# Altium project Raun_Programmer_Board.PrjPcb
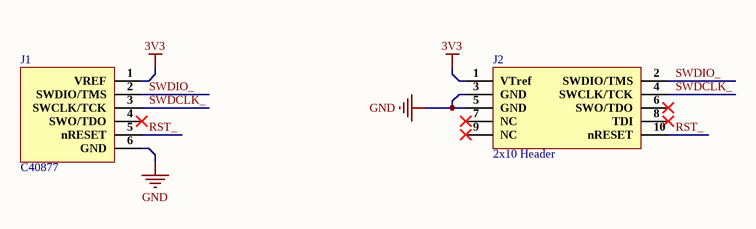
[diagram p0: Main_Sheet.SchDoc]
1 sheet, 2 parts. Net scope: global (net labels, ports and power ports of the same name join across sheets).
Board file: PB.PcbDoc

## Sheet Main_Sheet.SchDoc
size A4; SheetNumber: 1; SheetTotal: 1

### Parts
J1  C40877  [HDR_F_1X6]
J2  2x10 Header  [10Pin 1.27mm]

### Nets
3V3: J1.1(VREF) J2.1(VTref)
GND: J1.6(GND) J2.3(GND) J2.5(GND)
RST_: J1.5(nRESET) J2.10(nRESET)
SWDCLK_: J1.3(SWCLK/TCK) J2.4(SWCLK/TCK)
SWDIO_: J1.2(SWDIO/TMS) J2.2(SWDIO/TMS)

Not connected (* = marked no-connect by the designer): J1 4(SWO/TDO)*; J2 6(SWO/TDO)* 7(NC)* 8(TDI)* 9(NC)*

### Library data of the parts
J1 = C40877: 2.54mm Straight 1x6P 6 1 Straight,P=2.54mm Female Headers ROHS; Manufacturer: BOOMELE; Manufacturer Part Number: C40877; LCSC Part Number: C40877; ComponentLink1Description: LCSC; ComponentLink1URL: https://lcsc.com/product-detail/span-style-background-color-ff0-Female-span-Headers_BOOMELE-Boom-Precision-Elec-C40877_C40877.html
J2 = DW127R-22-10-23: 1A Straight Square Pins 1mm 3mm 2 10 2.3mm 1.27mm 1.27mm 2x5P Straight,P=1.27mm Pin Headers ROHS; Manufacturer: DEALON; Manufacturer Part Number: DW127R-22-10-23; Package: Custom; LCSC Part Number: C2935953; ComponentLink1Description: LCSC; ComponentLink1URL: https://lcsc.com/product-detail/span-style-background-color-ff0-Pin-span-Headers_DEALON-DW127R-22-10-23_C2935953.html